# Altium schematic sheet Main_Sheet.SchDoc
size 420 x 297 mm; SheetNumber: 1; SheetTotal: 1
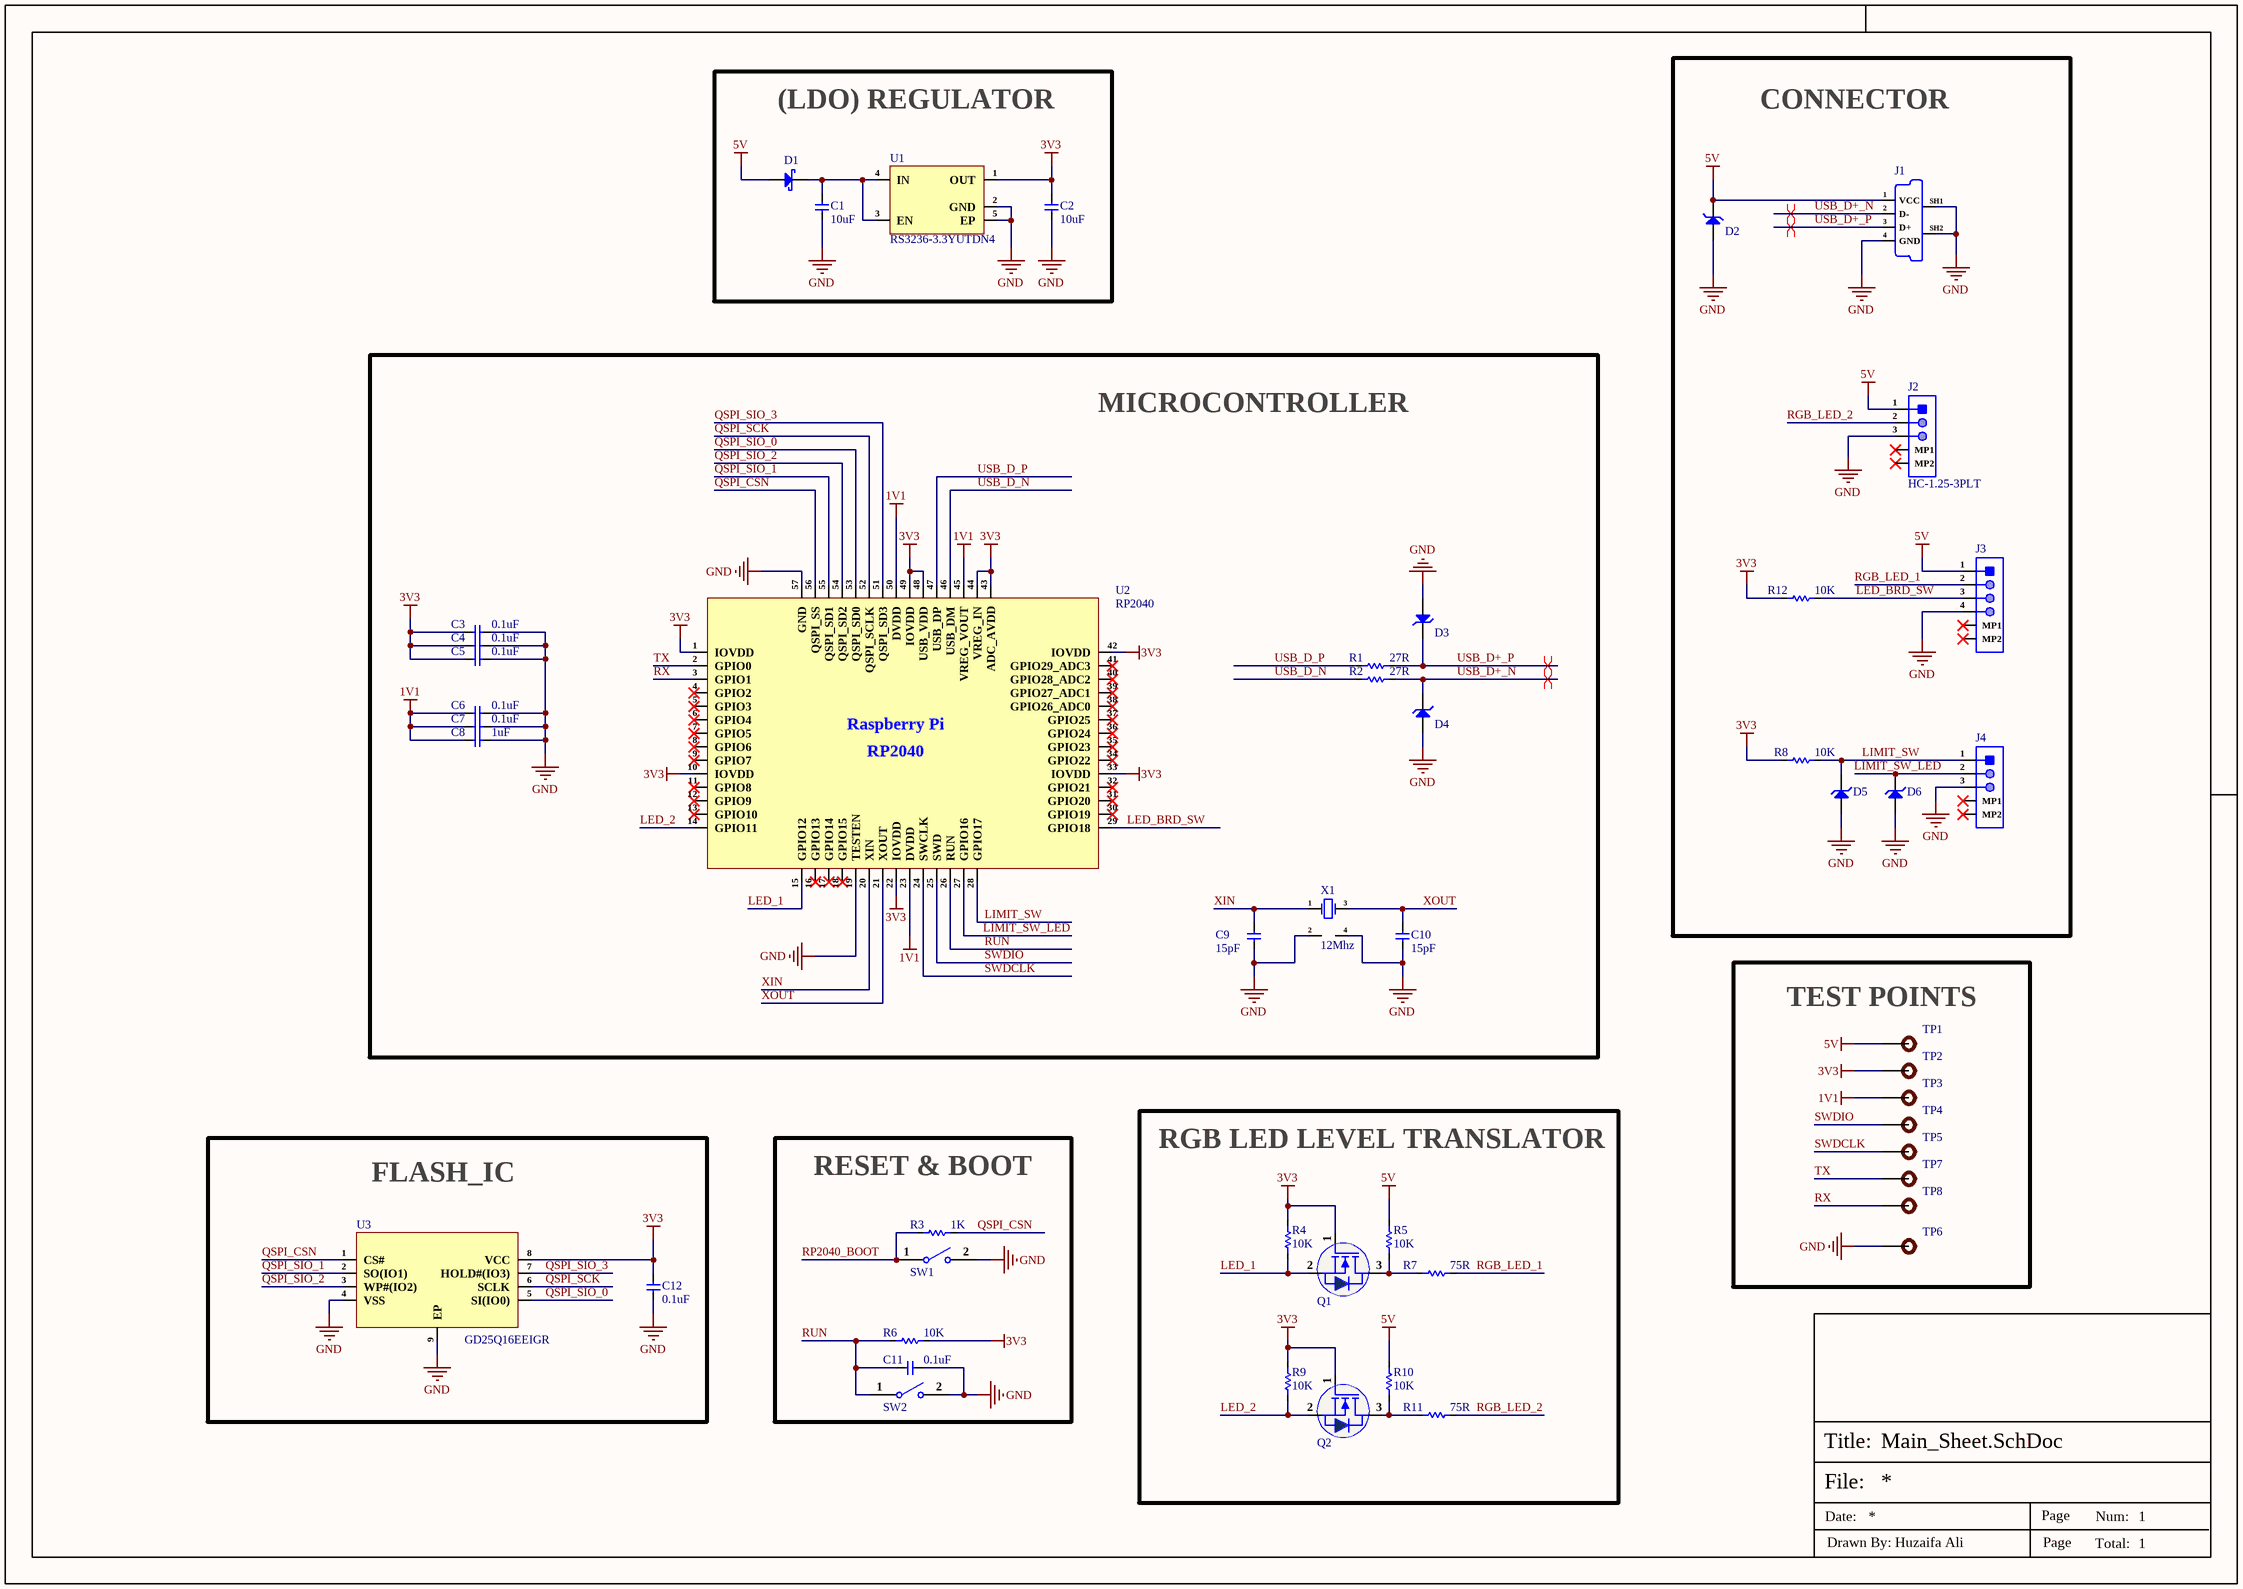
[diagram p0: Main_Sheet.SchDoc]

## Parts
C1  10uF  [Cap-0402]
C2  10uF  [Cap-0402]
C3  0.1uF  [CAP-0201]
C4  0.1uF  [CAP-0201]
C5  0.1uF  [CAP-0201]
C6  0.1uF  [CAP-0201]
C7  0.1uF  [CAP-0201]
C8  1uF  [Cap-0201]
C9  15pF  [Cap-0201]
C10  15pF  [Cap-0201]
C11  0.1uF  [CAP-0201]
C12  0.1uF  [CAP-0201]
D1  NSR0320MW2T1G  [SOD-323]  (value not drawn)
D2  DF2S6.8FS,L3M  [SOD-923.]  (value not drawn)
D3  DF2S6.8FS,L3M  [SOD-923.]  (value not drawn)
D4  DF2S6.8FS,L3M  [SOD-923.]  (value not drawn)
D5  MM3Z3V3B  [SOD323F]  (value not drawn)
D6  MM3Z3V3B  [SOD323F]  (value not drawn)
J1  USB-05.  [USB-05.]  (value not drawn)
J2  HC-1.25-3PLT  [HC-1.25-3PLT]
J3  SM04B-SRSS-TB(LF)(SN)  [SM04B-SRSS-TB(LF)(SN)]  (value not drawn)
J4  SM03B-SRSS-TB(LF)(SN)  [SM03B-SRSS-TB(LF)(SN)]  (value not drawn)
Q1  Si2302CDS  [Sot-23]  (value not drawn)
Q2  Si2302CDS  [Sot-23]  (value not drawn)
R1  27R  [Res-0201]
R2  27R  [Res-0201]
R3  1K  [Res-0201]
R4  10K  [Res-0201]
R5  10K  [Res-0201]
R6  10K  [Res-0201]
R7  75R  [Res-0201]
R8  10K  [Res-0201]
R9  10K  [Res-0201]
R10  10K  [Res-0201]
R11  75R  [Res-0201]
R12  10K  [Res-0201]
SW1  B3U-1000P  [B3U-1000P]  (value not drawn)
SW2  B3U-1000P  [B3U-1000P]  (value not drawn)
TP1  TEST POINT  [Test-point]  (value not drawn)  (no BOM)
TP2  TEST POINT  [Test-point]  (value not drawn)  (no BOM)
TP3  TEST POINT  [Test-point]  (value not drawn)  (no BOM)
TP4  TEST POINT  [Test-point]  (value not drawn)  (no BOM)
TP5  TEST POINT  [Test-point]  (value not drawn)  (no BOM)
TP6  TEST POINT  [Test-point]  (value not drawn)  (no BOM)
TP7  TEST POINT  [Test-point]  (value not drawn)  (no BOM)
TP8  TEST POINT  [Test-point]  (value not drawn)  (no BOM)
U1  RS3236-3.3YUTDN4  [XDFN-4-EP(1x1)]
U2  RP2040  [56-QFN (7x7)]
U3  GD25Q16EEIGR  [USON-8(2x3)]
X1  12Mhz  [SMD3225-4P]

## Blocks framed on the sheet
(LDO) REGULATOR: C1 C2 D1 U1
CONNECTOR: D2 D5 D6 J1-J4 R8 R12
MICROCONTROLLER: C3-C10 D3 D4 R1 R2 U2 X1
TEST POINTS: TP1-TP8
RGB LED LEVEL TRANSLATOR: Q1 Q2 R4 R5 R7 R9-R11
FLASH_IC: C12 U3
RESET & BOOT: C11 R3 R6 SW1 SW2

## Nets
1V1: C6.1 C7.1 C8.1 TP3.1 U2.23(DVDD) U2.45(VREG_VOUT) U2.50(DVDD)
3V3: C2.2 C3.1 C4.1 C5.1 C12.2 Q1.1(G) Q2.1(G) R4.2 R6.2 R8.1 R9.2 R12.1 TP2.1 U1.1(OUT) U2.1(IOVDD) U2.10(IOVDD) U2.22(IOVDD) U2.33(IOVDD) U2.42(IOVDD) U2.43(ADC_AVDD) U2.44(VREG_IN) U2.48(USB_VDD) U2.49(IOVDD) U3.8(VCC)
5V: D1.2(A) D2.1(K) J1.1(VCC) J2.1 J3.1 R5.2 R10.2 TP1.1
GND: C1.1 C2.1 C3.2 C4.2 C5.2 C6.2 C7.2 C8.2 C9.1 C10.1 C11.1 C12.1 D2.2(A) D3.2(A) D4.2(A) D5.1(A) D6.1(A) J1.4(GND) J1.SH1(Sheild) J1.SH2(Sheild) J2.3 J3.4 J4.3 SW1.2 SW2.2 TP6.1 U1.2(GND) U1.5(EP) U2.19(TESTEN) U2.57(GND) U3.4(VSS) U3.9(EP) X1.2(GND) X1.4(GND)
LED_1: Q1.2(S) R4.1 U2.15(GPIO12)
LED_2: Q2.2(S) R9.1 U2.14(GPIO11)
LED_BRD_SW: J3.3 R12.2 U2.29(GPIO18)
LIMIT_SW: D5.2(K) J4.1 R8.2 U2.28(GPIO17)
LIMIT_SW_LED: D6.2(K) J4.2 U2.27(GPIO16)
QSPI_CSN: R3.2 U2.56(QSPI_SS) U3.1(CS#)
QSPI_SCK: U2.52(QSPI_SCLK) U3.6(SCLK)
QSPI_SIO_0: U2.53(QSPI_SD0) U3.5(SI(IO0))
QSPI_SIO_1: U2.55(QSPI_SD1) U3.2(SO(IO1))
QSPI_SIO_2: U2.54(QSPI_SD2) U3.3(WP#(IO2))
QSPI_SIO_3: U2.51(QSPI_SD3) U3.7(HOLD#(IO3))
RGB_LED_1: J3.2 R7.2
RGB_LED_2: J2.2 R11.2
RP2040_BOOT: R3.1 SW1.1
RUN: C11.2 R6.1 SW2.1 U2.26(RUN)
RX: TP8.1 U2.3(GPIO1)
SWDCLK: TP5.1 U2.24(SWCLK)
SWDIO: TP4.1 U2.25(SWD)
TX: TP7.1 U2.2(GPIO0)
USB_D+_N: D4.1(K) J1.2(D-) R2.2
USB_D+_P: D3.1(K) J1.3(D+) R1.2
USB_D_N: R2.1 U2.46(USB_DM)
USB_D_P: R1.1 U2.47(USB_DP)
XIN: C9.2 U2.20(XIN) X1.1(OSC1)
XOUT: C10.2 U2.21(XOUT) X1.3(OSC2)
NetC1_2: C1.2 D1.1(K) U1.3(EN) U1.4(IN)
NetQ1_3: Q1.3(D) R5.1 R7.1
NetQ2_3: Q2.3(D) R10.1 R11.1

Not connected (* = marked no-connect by the designer): J2 MP1* MP2*; J3 MP1* MP2*; J4 MP1* MP2*; U2 4(GPIO2)* 5(GPIO3)* 6(GPIO4)* 7(GPIO5)* 8(GPIO6)* 9(GPIO7)* 11(GPIO8)* 12(GPIO9)* 13(GPIO10)* 16(GPIO13)* 17(GPIO14)* 18(GPIO15)* 30(GPIO19)* 31(GPIO20)* 32(GPIO21)* 34(GPIO22)* 35(GPIO23)* 36(GPIO24)* 37(GPIO25)* 38(GPIO26_ADC0)* 39(GPIO27_ADC1)* 40(GPIO28_ADC2)* 41(GPIO29_ADC3)*

## Layout directives
differential pair; differential pair class USB A: USB_D+_N, USB_D+_P

## Notes on the sheet
- File:
- Title:
- Date:
- Page
- Num:
- Total:
- Drawn By: Huzaifa Ali

## Library data of the parts
C1 C2 = CL05A106MP5NUNC: CAP CER 10UF 10V X5R 0402; Manufacturer: Samsung; Tolerance: 20%; Item Type: Capacitor; Supplier 1: Avnet; Manufacturer Part Number: CL05A106MP5NUNC; RoHS: Yes; Category: Ceramic Capacitors; Stock 1: 1729850; Pricing 1: 10000=0.02537 (USD); Mount: Surface Mount; Case/Package: 0402; Case Code (Metric): 1005; Case Code (Imperial): 0402; Contact Plating: Tin; Min Operating Temperature: -55°C; Max Operating Temperature: 85°C; Package Quantity: 1; Packaging: Tape and Reel; Capacitance: 10uF; Voltage Rating: 10V; Dielectric: X5R; Termination: Wraparound; Series: CL; Construction: Flat; Length: 1mm; Width: 0.02inch; Thickness: 0.028inch; Depth: 0.5mm; Radiation Hardening: No; Lead Free: Lead Free; RoHS Compliant: Yes; ComponentLink1URL: https://datasheet.ciiva.com/25721/cl05a106mp5nunc-25721584.pdf?src-supplier=Digi-Key; ComponentLink1Description: https://datasheet.ciiva.com/25721/cl05a106mp5nunc-25721584.pdf?src-supplier=Digi-Key; ComponentLink2URL: https://datasheet.ciiva.com/26838/getdatasheetpartid-745310-26838170.pdf?src-supplier=Verical; ComponentLink2Description: https://datasheet.ciiva.com/26838/getdatasheetpartid-745310-26838170.pdf?src-supplier=Verical; Supplier Part Number 1: CL05A106MP5NUNC; LCSC Part Number: C315248
C3-C7 C11 C12 = GRM033R61E104ME14D: CAP CER 0.1UF 25V X5R 0201; Manufacturer: Murata; Item Type: Capacitors; Material: 4241ConductorMaterial; Supplier: Future Electronics; LCSC Part Number: C2649557; Manufacturer Part Number: GRM033R61E104ME14D; RoHS: Yes; Stock: 270000; Pricing: 15000=0.0037, 45000=0.0036, 75000=0.0035, 300000=0.0034, 450000=0.0033 (USD); Voltage Rating (DC): 25V; Height: 330um; ComponentLink1URL: https://datasheet.octopart.com/GRM033R61E104ME14D-Murata-datasheet-96224008.pdf?src-supplier=Future+Electronics; ComponentLink1Description: https://datasheet.octopart.com/GRM033R61E104ME14D-Murata-datasheet-96224008.pdf?src-supplier=Future+Electronics; ComponentLink2URL: http://search.murata.co.jp/Ceramy/image/img/A01X/G101/ENG/GRM033R61E104ME14-01.pdf?src-supplier=Digikey; ComponentLink2Description: http://search.murata.co.jp/Ceramy/image/img/A01X/G101/ENG/GRM033R61E104ME14-01.pdf?src-supplier=Digikey; ComponentLink3URL: http://psearch.en.murata.com/capacitor/product/GRM033R61E104ME14%23.pdf?src-supplier=Avnet; ComponentLink3Description: http://psearch.en.murata.com/capacitor/product/GRM033R61E104ME14%23.pdf?src-supplier=Avnet
C8 = CC0201KRX5R5BB105: CAP CER 1UF 6.3V X5R 0201; Manufacturer: Yageo; Tolerance: 10%; Item Type: Capacitor; Supplier 1: Arrow Electronics; Manufacturer Part Number: CC0201KRX5R5BB105; RoHS: Yes; Category: Ceramic Capacitors; Stock 1: 600000; Pricing 1: 15000=0.00740 (USD); Mount: Surface Mount; Case/Package: 0201; Case Code (Imperial): 0201; Case Code (Metric): 0603; Min Operating Temperature: -55°C; Max Operating Temperature: 85°C; Packaging: Cut Tape; Capacitance: 1uF; Voltage Rating: 6.3V; RoHS Compliant: Yes; ComponentLink1URL: http://www.yageo.com/documents/recent/UPY-GPHC_X5R_4V-to-50V_25.pdf?src-supplier=Digi-Key; ComponentLink1Description: http://www.yageo.com/documents/recent/UPY-GPHC_X5R_4V-to-50V_25.pdf?src-supplier=Digi-Key; ComponentLink2URL: https://www.yageo.com/upload/media/product/productsearch/datasheet/mlcc/UPY-GPHC_X5R_4V-to-50V_26.pdf?src-supplier=Digi-Key; ComponentLink2Description: https://www.yageo.com/upload/media/product/productsearch/datasheet/mlcc/UPY-GPHC_X5R_4V-to-50V_26.pdf?src-supplier=Digi-Key; Supplier Part Number 1: CC0201KRX5R5BB105; LCSC Part Number: C541330
C9 C10 = CC0201JRNPO9BN150: CAP CER 15PF 50V C0G/NPO 0201; Manufacturer: Yageo; Item Type: Capacitor; Supplier: Future Electronics; Supplier Part Number: 2580314; Manufacturer Part Number: CC0201JRNPO9BN150; RoHS: Yes; Category: Ceramic Capacitors; Stock: 585000; Pricing: 15000=0.0012, 60000=0.0011, 225000=0.0011, 600000=0.001, 1500000=0.001 (USD); ComponentLink1URL: https://datasheet.ciiva.com/176/mlccorderingcode-176501.pdf?src-supplier=Digi-Key; ComponentLink1Description: https://datasheet.ciiva.com/176/mlccorderingcode-176501.pdf?src-supplier=Digi-Key; ComponentLink2URL: https://datasheet.ciiva.com/176/mlccorderingcode-176502.pdf?src-supplier=Digi-Key; ComponentLink2Description: https://datasheet.ciiva.com/176/mlccorderingcode-176502.pdf?src-supplier=Digi-Key; ComponentLink3URL: https://datasheet.ciiva.com/176/mlccorderingcode-176503.pdf?src-supplier=Digi-Key; ComponentLink3Description: https://datasheet.ciiva.com/176/mlccorderingcode-176503.pdf?src-supplier=Digi-Key; ComponentLink4URL: https://datasheet.ciiva.com/17205/upy-gp-np0-16v-to-50v-8-17205625.pdf?src-supplier=Future+Electronics; ComponentLink4Description: https://datasheet.ciiva.com/17205/upy-gp-np0-16v-to-50v-8-17205625.pdf?src-supplier=Future+Electronics; LCSC Part Number: C277480
D1 = NSR0320MW2T1G: DIODE SCHOTTKY 20V 1A SOD323; Manufacturer: ON Semiconductor; Max Reverse Current: 50uA; Forward Voltage: 500mV; Max Repetitive Reverse Voltage (Vrrm): 23V; Max Forward Surge Current (Ifsm): 5A; Power Dissipation: 200mW; Element Configuration: Single; Value: 25pF; Supplier: Future Electronics; LCSC Part Number: C48192; Manufacturer Part Number: NSR0320MW2T1G; RoHS: Yes; Item Type: Diode; Stock: 165000; Pricing: 3000=0.0283, 9000=0.0276, 15000=0.0273, 30000=0.0253, 60000=0.0265, 90000=0.0259 (USD); Case/Package: SOD-323-2; Pins: 2; Min Operating Temperature: -55°C; Max Operating Temperature: 125°C; Forward Current: 1A; Package Quantity: 1; Packaging: Tape and Reel; Average Rectified Current: 1A; Max Reverse Leakage Current: 50uA; Max Reverse Voltage (DC): 20V; Series: -; Reverse Voltage: 20V; Length: 1.8mm; Width: 1.35mm; Height: 0.9mm; Radiation Hardening: No; Reach SVHC Compliant: No; Lead Free: Lead Free; RoHS Compliant: Yes; ComponentLink1URL: https://datasheet.ciiva.com/915/nsr0320mw2t1-d-915506.pdf?src-supplier=Avnet; ComponentLink1Description: https://datasheet.ciiva.com/915/nsr0320mw2t1-d-915506.pdf?src-supplier=Avnet; ComponentLink2URL: https://datasheet.ciiva.com/4714/nsr0320mw2t1-d-97861-4714197.pdf?src-supplier=Mouser; ComponentLink2Description: https://datasheet.ciiva.com/4714/nsr0320mw2t1-d-97861-4714197.pdf?src-supplier=Mouser; ComponentLink3URL: https://datasheet.ciiva.com/915/nsr0320mw2t1-d-915508.pdf?src-supplier=Digikey; ComponentLink3Description: https://datasheet.ciiva.com/915/nsr0320mw2t1-d-915508.pdf?src-supplier=Digikey; ComponentLink4URL: https://datasheet.ciiva.com/16210/nsr0320mw2t1-d-16210139.pdf?src-supplier=Future+Electronics; ComponentLink4Description: https://datasheet.ciiva.com/16210/nsr0320mw2t1-d-16210139.pdf?src-supplier=Future+Electronics
D2-D4 = DF2S6.8FS,L3M: TVS DIODE 5VWM 9VC SOD923; Manufacturer: Toshiba; Item Type: TVS Diodes; Number of Unidirectional Channels: 1; Reverse Standoff Voltage: 5V; Min Breakdown Voltage: 6.4V; Power Line Protection: No; Peak Pulse Current: 1A; Diode Type: ZENER; Supplier: Digikey; LCSC Part Number: C1972978; Manufacturer Part Number: DF2S6.8FS,L3M; RoHS: No; Stock: 487248; Pricing: 1=0.1, 10=0.068, 100=0.031, 500=0.0275, 1000=0.024, 2000=0.022, 5000=0.02 (USD); Mounting Technology: Surface Mount; Packaging: Cut Tape; Series: -; RoHS Compliant: No; ComponentLink1URL: http://www.mouser.com/ds/2/408/DF2S6.8FS_datasheet_en_20140709-708755.pdf?src-supplier=Mouser; ComponentLink1Description: http://www.mouser.com/ds/2/408/DF2S6.8FS_datasheet_en_20140709-708755.pdf?src-supplier=Mouser; ComponentLink2URL: https://toshiba.semicon-storage.com/info/docget.jsp?did=22219&prodName=DF2S6.8FS&src-supplier=Digikey; ComponentLink2Description: https://toshiba.semicon-storage.com/info/docget.jsp?did=22219&prodName=DF2S6.8FS&src-supplier=Digikey
D5 D6 = MM3Z3V3B: DIODE ZENER 3.3V 200MW SOD323F; Manufacturer: ON Semiconductor / Fairchild; Forward Voltage: 1V; Tolerance: 2%; Impedance: 89R; Max Reverse Leakage Current: 4.5uA; Test Current: 5mA; Element Configuration: Single; Supplier 1: Digi-Key; Manufacturer Part Number: MM3Z3V3B; Stock 1: 473644; Pricing 1: 1=0.22, 10=0.18, 100=0.0956, 500=0.06288, 1000=0.04276 (USD); Mount: Surface Mount; Number of Pins: 2; Weight: 0.0276g; Min Operating Temperature: -65°C; Max Operating Temperature: 150°C; Packaging: Tape and Reel; Package Quantity: 1; Max Power Dissipation: 200mW; Zener Voltage: 3.3V; Voltage Tolerance: 2%; Power Dissipation: 200mW; Working Voltage: 3.3V; Peak Reverse Current: 4.5uA; Length: 1.3mm; Height: 1mm; Width: 1.7mm; Radiation Hardening: No; REACH SVHC: No SVHC; Lead Free: Lead Free; ComponentLink1URL: http://www.onsemi.com/pub/Collateral/MM3Z9V1B-D.pdf?src-supplier=Digi-Key; ComponentLink1Description: http://www.onsemi.com/pub/Collateral/MM3Z9V1B-D.pdf?src-supplier=Digi-Key; ComponentLink2URL: http://www.mouser.com/ds/2/149/MM3Z3V3B-187166.pdf?src-supplier=Mouser; ComponentLink2Description: http://www.mouser.com/ds/2/149/MM3Z3V3B-187166.pdf?src-supplier=Mouser; ComponentLink3URL: https://www.fairchildsemi.com/datasheets/MM/MM3Z9V1B.pdf?src-supplier=Avnet; ComponentLink3Description: https://www.fairchildsemi.com/datasheets/MM/MM3Z9V1B.pdf?src-supplier=Avnet; ComponentLink4URL: http://www.farnell.com/datasheets/1706525.pdf?src-supplier=Element14; ComponentLink4Description: http://www.farnell.com/datasheets/1706525.pdf?src-supplier=Element14; Supplier Part Number 1: MM3Z3V3BCT-ND; LCSC Part Number: C2978865; Item Type: Diode
J1 = USB-05.: USB 2.0 1 4P Public Type-A Plugin USB Connectors ROHS; Manufacturer: SOFNG; Manufacturer Part Number: USB-05; Package: Plugin; LCSC Part Number: C112454; Item Type: USB 2.0 1 4P Public Type-A Plugin USB Connectors ROHS; ComponentLink1Description: LCSC; ComponentLink1URL: https://www.lcsc.com/product-detail/USB-Connectors_SOFNG-USB-05_C112454.html
J2 = HC-1.25-3PLT: 1x3P 3P PicoBlade(MX 1.25) Tin 3 -25℃~+85℃ 2A 1 1.25mm Brass Standing paste SMD,P=1.25mm Wire To Board Connector ROHS; Manufacturer: HCTL; Manufacturer Part Number: HC-1.25-3PLT; Package: SMD,P=1.25mm; LCSC Part Number: C2845389; Item Type: Connector; ComponentLink1Description: LCSC; ComponentLink1URL: https://www.lcsc.com/product-detail/Wire-To-Board-Connector_HCTL-HC-1-25-3PLT_C2845389.html
J3 = SM04B-SRSS-TB(LF)(SN): CONN HEADER SMD R/A 4POS 1MM; Manufacturer: JST; Item Type: Headers and Wire Housings; Voltage Rating: 50V; Number of Contacts: 4NUMBER; Contact Resistance: 40mR; Max Current Rating: 1A; Number of Positions: 4; Supplier: Future Electronics; LCSC Part Number: C160404; Manufacturer Part Number: SM04B-SRSS-TB(LF)(SN); RoHS: Yes; Stock: 27000; Pricing: 3000=0.285, 6000=0.275 (USD); Mounting Technology: Surface Mount; Contact Material: Copper Alloy; Contact Plating: Copper,Tin; Housing Color: Beige; Housing Material: Polyamide; Contact Shape: Square; Contact Finish - Mating: TIN; Insulation Material: Nylon; Insulation Color: Natural; Min Operating Temperature: -25°C; Max Operating Temperature: 85°C; Number of Rows: 1; Termination: Solder; Orientation: Right Angle; Packaging: Tape and Reel; Max Voltage Rating (AC): 50V; Max Voltage Rating (DC): 50V; Connector Type: Header; Fastening Type: Pull; Series: SR; Contact Type: Male Pin; Length: 6mm; Pitch: 1mm; Depth: 4.95mm; Flammability Rating: UL94 V-0; ComponentLink1URL: https://datasheet.ciiva.com/26894/getdatasheetpartid-640736-26894676.pdf?src-supplier=Verical; ComponentLink1Description: https://datasheet.ciiva.com/26894/getdatasheetpartid-640736-26894676.pdf?src-supplier=Verical; ComponentLink2URL: https://datasheet.ciiva.com/26894/getdatasheetpartid-499363-26894945.pdf?src-supplier=Verical; ComponentLink2Description: https://datasheet.ciiva.com/26894/getdatasheetpartid-499363-26894945.pdf?src-supplier=Verical; ComponentLink3URL: https://datasheet.ciiva.com/16487/jstsm04b-srss-tb-lf-sn-16487222.pdf?src-supplier=Future+Electronics; ComponentLink3Description: https://datasheet.ciiva.com/16487/jstsm04b-srss-tb-lf-sn-16487222.pdf?src-supplier=Future+Electronics
J4 = SM03B-SRSS-TB(LF)(SN): CONN HEADER SMD R/A 3POS 1MM; Manufacturer: JST; Item Type: Connectors; Gender: 29Gender; Supplier: Future Electronics; LCSC Part Number: C160403; Manufacturer Part Number: SM03B-SRSS-TB(LF)(SN); RoHS: Yes; Stock: 6000; Pricing: 3000=0.22, 6000=0.215 (USD); Lead Free: 5697LeadFree; ComponentLink1URL: https://datasheet.ciiva.com/26894/getdatasheetpartid-708885-26894671.pdf?src-supplier=Verical; ComponentLink1Description: https://datasheet.ciiva.com/26894/getdatasheetpartid-708885-26894671.pdf?src-supplier=Verical; ComponentLink2URL: https://datasheet.ciiva.com/8052/91630-8052263.pdf?src-supplier=Element14; ComponentLink2Description: https://datasheet.ciiva.com/8052/91630-8052263.pdf?src-supplier=Element14; ComponentLink3URL: https://datasheet.ciiva.com/16394/sm03b-srss-tblfsn-16394332.pdf?src-supplier=Future+Electronics; ComponentLink3Description: https://datasheet.ciiva.com/16394/sm03b-srss-tblfsn-16394332.pdf?src-supplier=Future+Electronics
Q1 Q2 = Si2302CDS: N-CHANNEL 20-V (D-S) MOSFET; Manufacturer: TECH PUBLIC; ComponentLink1Description: LCSC; ComponentLink1URL: https://www.lcsc.com/product-detail/MOSFETs_TECH-PUBLIC-SI2302CDS_C5310968.html; Manufacturer Part Number: SI2302CDS; Package: SOT-23; LCSC Part Number: C5310968; Item Type: Mosfet
R1 R2 = RC0201FR-0727RL: RES 27 OHM 1% 1/20W 0201; Manufacturer: Yageo; Item Type: Resistors; Supplier: Future Electronics; LCSC Part Number: C273268; Manufacturer Part Number: RC0201FR-0727RL; RoHS: Yes; Stock: 20000; Pricing: 10000=0.0007, 50000=0.0006, 250000=0.0006, 1000000=0.0006, 2500000=0.0006 (USD); ComponentLink1URL: http://www.mouser.com/ds/2/447/RC0201-559633.pdf?src-supplier=Mouser; ComponentLink1Description: http://www.mouser.com/ds/2/447/RC0201-559633.pdf?src-supplier=Mouser; ComponentLink2URL: https://datasheet.octopart.com/RC0201FR-0727RL-Yageo-datasheet-164759695.pdf?src-supplier=Future+Electronics; ComponentLink2Description: https://datasheet.octopart.com/RC0201FR-0727RL-Yageo-datasheet-164759695.pdf?src-supplier=Future+Electronics; ComponentLink3URL: https://www.yageo.com/upload/media/product/productsearch/datasheet/rchip/PYu-RC_Group_51_RoHS_L_11.pdf?src-supplier=Digikey; ComponentLink3Description: https://www.yageo.com/upload/media/product/productsearch/datasheet/rchip/PYu-RC_Group_51_RoHS_L_11.pdf?src-supplier=Digikey; ComponentLink4URL: http://www.yageo.com/documents/recent/PYu-RC_Group_51_RoHS_L_9.pdf?src-supplier=Digikey; ComponentLink4Description: http://www.yageo.com/documents/recent/PYu-RC_Group_51_RoHS_L_9.pdf?src-supplier=Digikey
R3 = RC0201FR-071KL: RES 1K OHM 1% 1/20W 0201; Manufacturer: Yageo; Value: 1kR; Temperature Coefficient: 200ppm/°C; Power Rating: 50mW; Voltage Rating: 25V; Item Type: Resistor; Supplier: Digi-Key; Supplier Part Number: 311-1KMCT-ND; Manufacturer Part Number: RC0201FR-071KL; RoHS: Yes; Category: Chip SMD Resistors; Stock: 5606340; Pricing: 1=0.1, 10=0.027, 50=0.0172, 100=0.0143, 500=0.00988, 1000=0.00854, 5000=0.00629 (USD); Case/Package: 0201; Contact Plating: Tin,Matte; Case Code (Metric): 0603; Case Code (Imperial): 0201; Min Operating Temperature: -55°C; Max Operating Temperature: 125°C; Tolerance: 1%; Resistor Type: Thick Film; Package Quantity: 10000; Packaging: Tape and Reel; Number of Terminations: 2; Termination: SMD/SMT; Max Power Dissipation: 50mW; Working Voltage: 25V; Features: Moisture Resistant; Series: RC; Resistance Tolerance: 1%; Technology: THICK FILM; Construction: Rectangular; Voltage Rating (DC): 25V; Length: 0.024inch; Width: 0.012inch; Height: 0.01inch; Depth: 0.3mm; Military Standard: Not; RoHS Compliant: Yes; Reach SVHC Compliant: Unknown; Lead Free: 5697LeadFree; ComponentLink1URL: https://datasheet.ciiva.com/7672/1563626-7672204.pdf?src-supplier=Element14; ComponentLink1Description: https://datasheet.ciiva.com/7672/1563626-7672204.pdf?src-supplier=Element14; ComponentLink2URL: https://datasheet.ciiva.com/22698/1563626-22698505.pdf?src-supplier=Element14; ComponentLink2Description: https://datasheet.ciiva.com/22698/1563626-22698505.pdf?src-supplier=Element14; ComponentLink3URL: https://datasheet.ciiva.com/29721/pyu-r-int-thick-7-29721196.pdf?src-supplier=Digi-Key; ComponentLink3Description: https://datasheet.ciiva.com/29721/pyu-r-int-thick-7-29721196.pdf?src-supplier=Digi-Key; ComponentLink4URL: https://datasheet.ciiva.com/29721/pyu-r-int-thick-7-29721195.pdf?src-supplier=Digi-Key; ComponentLink4Description: https://datasheet.ciiva.com/29721/pyu-r-int-thick-7-29721195.pdf?src-supplier=Digi-Key; ComponentLink5URL: https://datasheet.ciiva.com/8896/pyu-rc0201-51-rohs-l-8-8896174.pdf?src-supplier=Avnet; ComponentLink5Description: https://datasheet.ciiva.com/8896/pyu-rc0201-51-rohs-l-8-8896174.pdf?src-supplier=Avnet; LCSC Part Number: C138165
R4-R6 R8-R10 R12 = RC0201FR-0710KL: RES SMD 10K OHM 1% 1/20W 0201; Manufacturer: Yageo; Item Type: Resistor; Manufacturer Part Number: RC0201FR-0710KL; Package: 0201; ComponentLink7Description: LCSC; ComponentLink7URL: https://www.lcsc.com/product-detail/Chip-Resistor-Surface-Mount_YAGEO-RC0201FR-0710KL_C106225.html; LCSC Part Number: C106225
R7 R11 = RC0201FR-0775RL: RES 75 OHM 1% 1/20W 0201; Manufacturer: Yageo; Item Type: Chip SMD Resistors; Supplier: Digikey; LCSC Part Number: C274878; Manufacturer Part Number: RC0201FR-0775RL; RoHS: Yes; Stock: 3381; Pricing: 1=0.1, 10=0.028, 50=0.0176, 100=0.0146, 500=0.00992, 1000=0.00853, 5000=0.00626 (USD); ComponentLink1URL: https://datasheet.ciiva.com/14985/pyu-r-int-thick-7-14985434.pdf?src-supplier=Digikey; ComponentLink1Description: https://datasheet.ciiva.com/14985/pyu-r-int-thick-7-14985434.pdf?src-supplier=Digikey
SW1 SW2 = B3U-1000P: SWITCH TACTILE SPST-NO 0.05A 12V; Manufacturer: Omron; Mechanical Life: 200000Cycles; Operating Force: 1.5N; Throw Configuration: SPST; Current Rating: 50mA; Contact Resistance: 100mR; Illumination Type: Non-Illuminated,Illuminated; Switch Travel: 0.15mm; Switch Function: Off-Mom; Actuator Type: Standard; Actuator Length: 0.4mm; Ratings: Dust Proof,IP40; ComponentLink1URL: http://www.farnell.com/datasheets/60838.pdf?src-supplier=Farnell; ComponentLink1Description: http://www.farnell.com/datasheets/60838.pdf?src-supplier=Farnell; ComponentLink2URL: http://www.farnell.com/datasheets/60838.pdf?src-supplier=Element14; ComponentLink2Description: http://www.farnell.com/datasheets/60838.pdf?src-supplier=Element14; ComponentLink3URL: https://omronfs.omron.com/en_US/ecb/products/pdf/en-b3u.pdf?src-supplier=Digi-Key; ComponentLink3Description: https://omronfs.omron.com/en_US/ecb/products/pdf/en-b3u.pdf?src-supplier=Digi-Key; ComponentLink4URL: http://www.omron.com/ecb/products/pdf/en-b3u.pdf?src-supplier=Digi-Key; ComponentLink4Description: http://www.omron.com/ecb/products/pdf/en-b3u.pdf?src-supplier=Digi-Key; ComponentLink5URL: https://www.distrelec.biz/Web/Downloads/he/et/B3U_eng_datasheet.pdf?mime=application%2Fpdf&src-supplier=Distrelec; ComponentLink5Description: https://www.distrelec.biz/Web/Downloads/he/et/B3U_eng_datasheet.pdf?mime=application%2Fpdf&src-supplier=Distrelec; ComponentLink6URL: http://www.onlinecomponents.com/productFiles/mf-OM/en-b3u.pdf?src-supplier=Onlinecomponents.com; ComponentLink6Description: http://www.onlinecomponents.com/productFiles/mf-OM/en-b3u.pdf?src-supplier=Onlinecomponents.com; Supplier 1: Digi-Key; Manufacturer Part Number: B3U-1000P; Stock 1: 116454; Pricing 1: 1=1, 10=0.961, 25=0.9064, 50=0.7976, 100=0.7251, 250=0.68888, 500=0.67074, 1000=0.52571 (USD); Mount: Surface Mount; Weight: 0.000776oz; Contact Material: Silver; Min Operating Temperature: -25°C; Max Operating Temperature: 70°C; Packaging: Tape and Reel; Voltage Rating (DC): 12V; Package Quantity: 1; Max Current Rating: 50mA; Termination: SMD/SMT; Orientation: Straight; Max Voltage Rating (DC): 12V; Electrical Life: 200000Cycles; Insulation Resistance: 100MR; Contact Current Rating: 50mA; Length: 4mm; Height: 1.2mm; Depth: 2.5mm; Width: 3mm; REACH SVHC: Unknown; Lead Free: Lead Free; ComponentLink7URL: https://www.verical.com/server-webapp/html/getDatasheet?partID=552554&src-supplier=Verical; ComponentLink7Description: https://www.verical.com/server-webapp/html/getDatasheet?partID=552554&src-supplier=Verical; ComponentLink8URL: http://www.farnell.com/datasheets/1685550.pdf?src-supplier=Element14; ComponentLink8Description: http://www.farnell.com/datasheets/1685550.pdf?src-supplier=Element14; ComponentLink9URL: http://www.farnell.com/datasheets/2610940.pdf?src-supplier=Farnell; ComponentLink9Description: http://www.farnell.com/datasheets/2610940.pdf?src-supplier=Farnell; ComponentLink10URL: https://www.alliedelec.com/m/d/4c8a9ef82804fc3c241a13c1e298fd73.pdf?src-supplier=Allied+Electronics; ComponentLink10Description: https://www.alliedelec.com/m/d/4c8a9ef82804fc3c241a13c1e298fd73.pdf?src-supplier=Allied+Electronics; Supplier Part Number 1: SW1020DKR-ND; LCSC Part Number: C231329; Item Type: Switch
TP1-TP8 = TEST POINT: Test Point ON; Item Type: TEST POINT
U1 = RS3236-3.3YUTDN4: 500mA 70dB@(1kHz) Fixed 3.3V Positive electrode 7.5V XDFN-4-EP(1x1) Voltage Regulators - Linear, Low Drop Out (LDO) Regulators ROHS; Manufacturer: RUNIC Technology; Item Type: IC; Supplier: LCSC; LCSC Part Number: C379350; Manufacturer Part Number: RS3236-3.3YUTDN4; RoHS: No
U2 = RP2040: 133MHz LQFN-56(7x7) Microcontrollers (MCU/MPU/SOC) ROHS; Manufacturer: Raspberry Pi; Item Type: IC; Manufacturer Part Number: RP2040; Package: LQFN-56(7x7); LCSC Part Number: C2040; ComponentLink1Description: LCSC; ComponentLink1URL: https://www.lcsc.com/product-detail/Microcontrollers-MCU-MPU-SOC_Raspberry-Pi-RP2040_C2040.html
U3 = GD25Q16EEIGR: IC FLASH 16MBIT SPI/QUAD 8USON; Manufacturer: GigaDevice; Supplier: Digikey; LCSC Part Number: C2986331; Manufacturer Part Number: GD25Q16EEIGR; RoHS: No; Item Type: IC; Stock: 2468; Pricing: 1=0.84, 10=0.75, 25=0.7152, 50=0.69, 100=0.6658, 250=0.63504, 500=0.61266, 1000=0.59108 (USD)
X1 = ABM8-272-T3: CRYSTAL 12.0000MHZ 10PF SMD; Manufacturer: Abracon; Item Type: Crytal; Supplier: Mouser; LCSC Part Number: C20625731; Manufacturer Part Number: ABM8-272-T3; RoHS: No; Stock: 14884; Pricing: 1=0.58, 10=0.452, 50=0.452, 100=0.421, 1000=0.358, 10000=0.296 (USD)